# Altium schematic sheet Controller_Sheet.SchDoc
size 420 x 297 mm; SheetNumber: 4; SheetTotal: 12
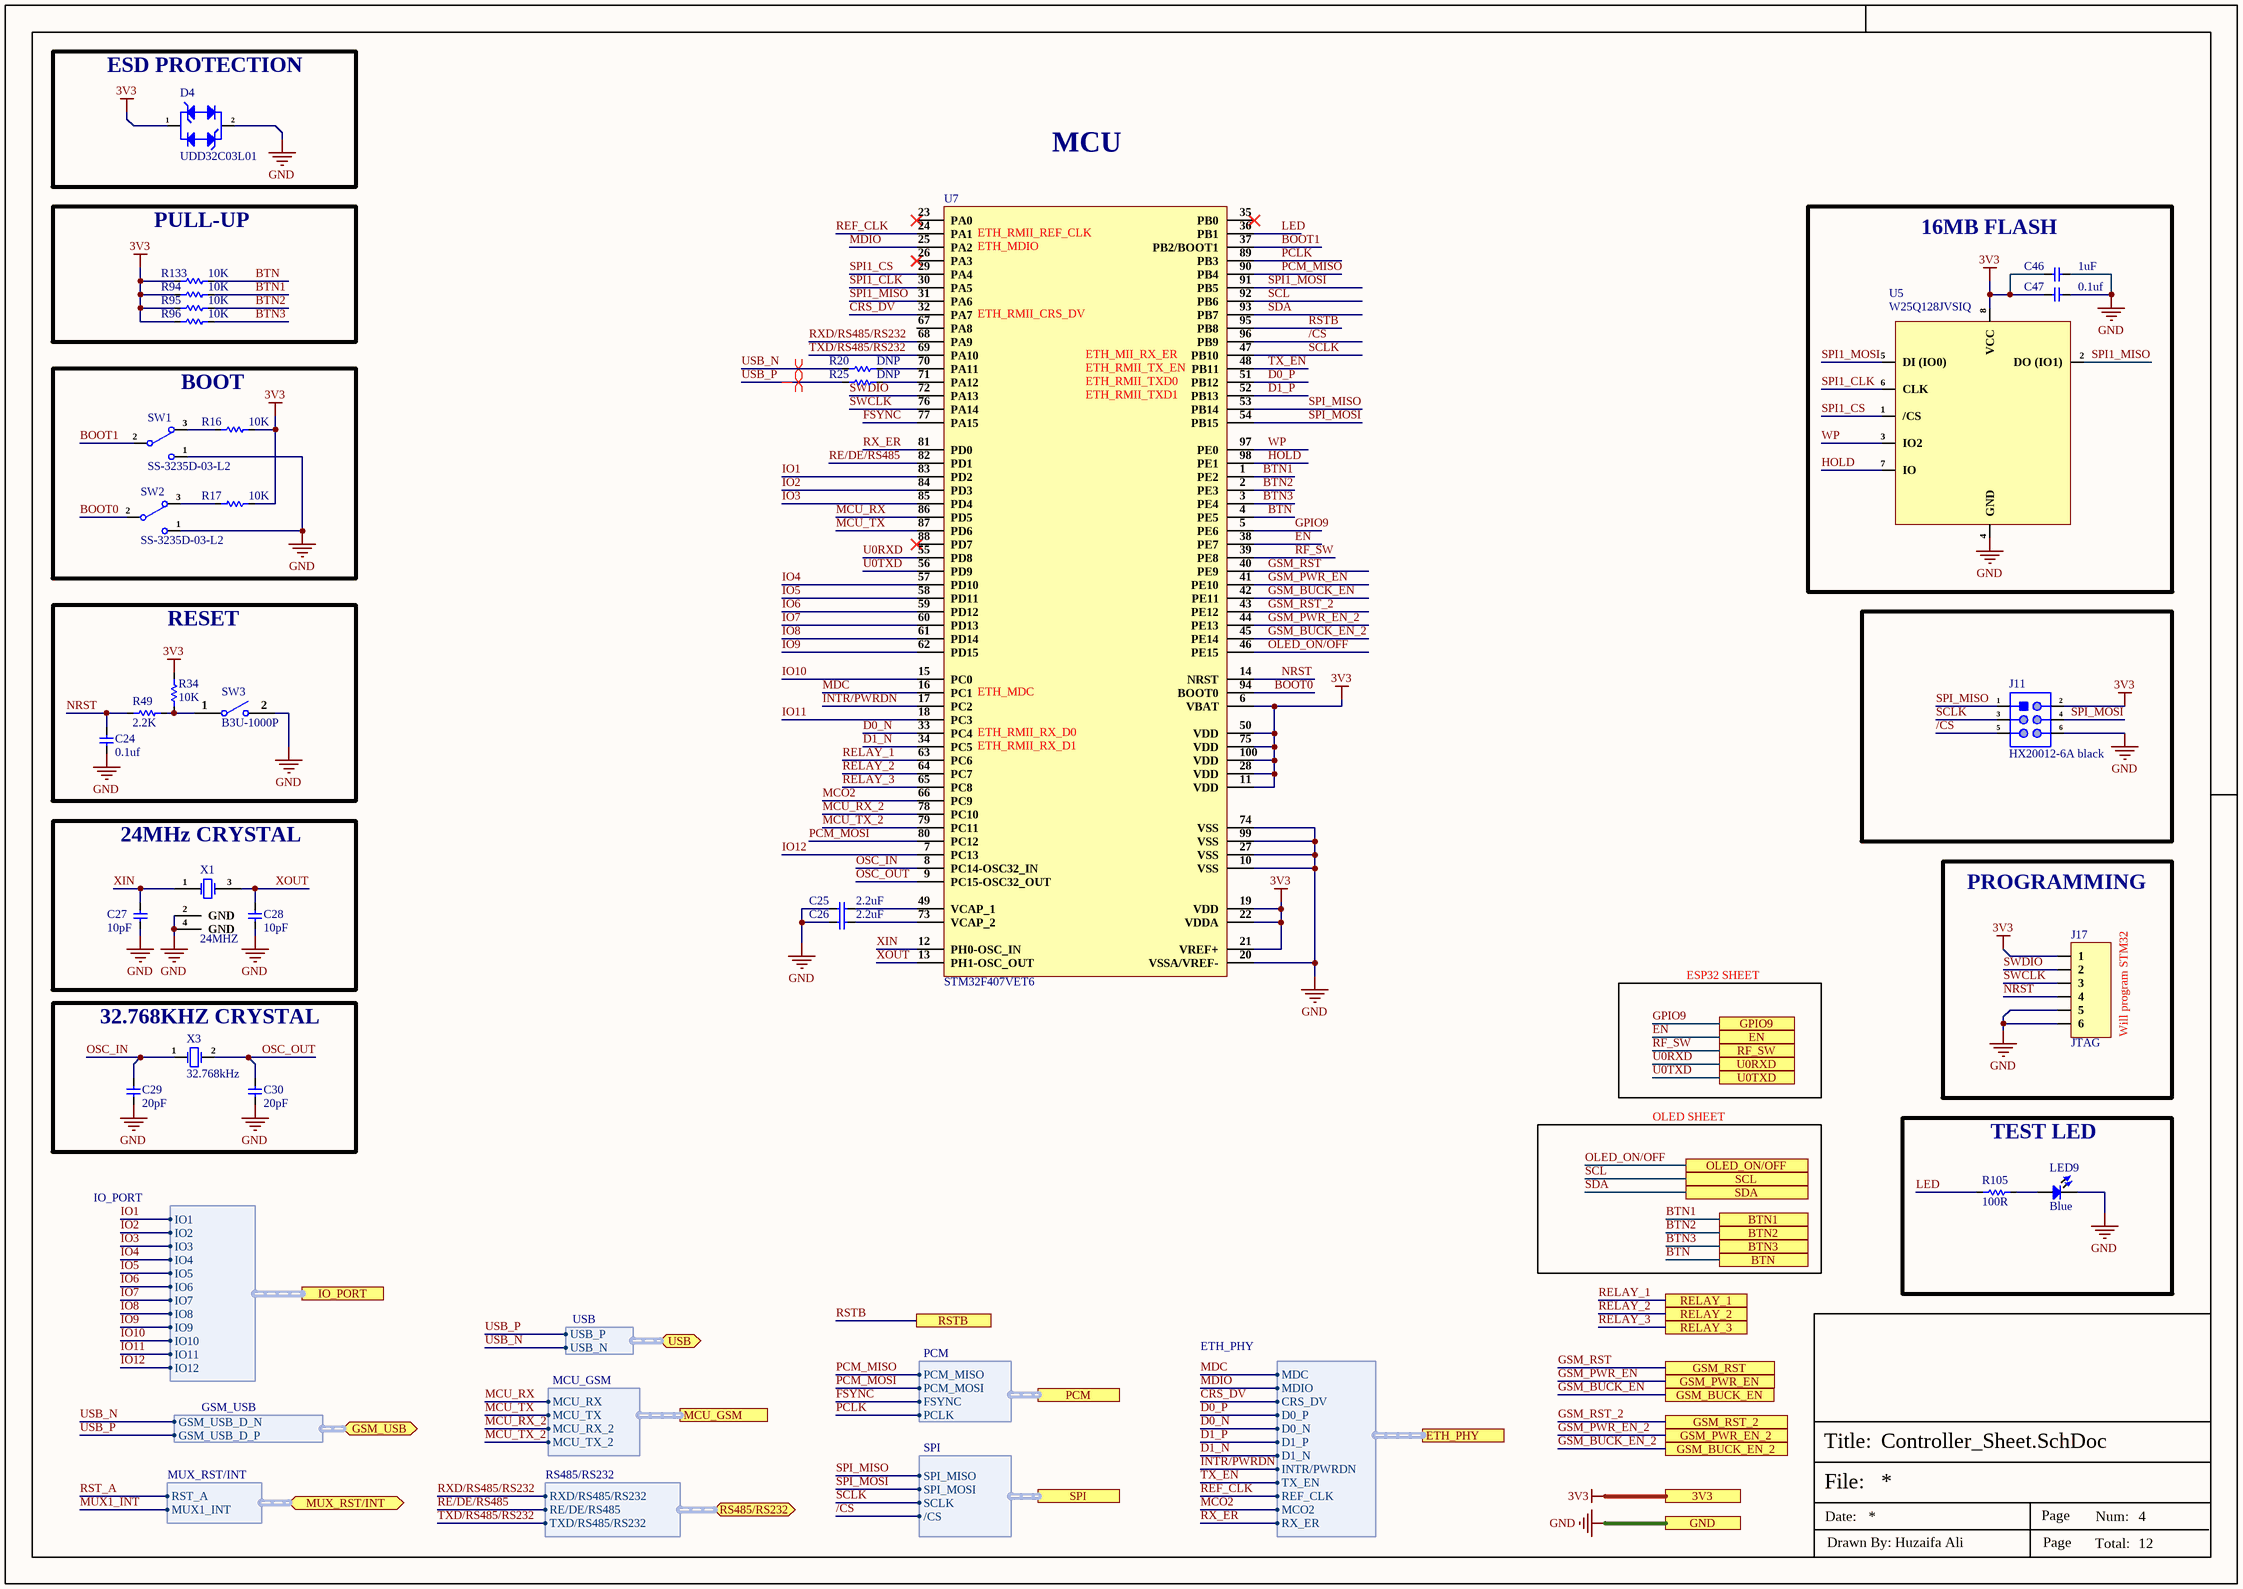
[diagram p0: Controller_Sheet.SchDoc]

## Parts
C24  0.1uf  [Cap-0402]
C25  2.2uF  [Cap-0603]
C26  2.2uF  [Cap-0603]
C27  10pF  [Cap-0603]
C28  10pF  [Cap-0603]
C29  20pF  [Cap-0603]
C30  20pF  [Cap-0603]
C46  1uF  [CAP-0201]
C47  0.1uf  [Cap-0402]
D4  UDD32C03L01  [SOD-323]
J11  HX20012-6A black  [HX20012-6A black]
J17  JTAG  [POGO 6 Pin]
LED9  Blue  [LED-0603]
R16  10K  [Res-0201]
R17  10K  [Res-0201]
R20  DNP  [Res-0402]
R25  DNP  [Res-0402]
R34  10K  [Res-0201]
R49  2.2K  [Res-0603]
R94  10K  [Res-0201]
R95  10K  [Res-0201]
R96  10K  [Res-0201]
R105  100R  [Res-0402]
R133  10K  [Res-0201]
SW1  SS-3235D-03-L2  [SS-3235D-03-L2_]
SW2  SS-3235D-03-L2  [SS-3235D-03-L2_]
SW3  B3U-1000P  [B3U-1000P]
U5  W25Q128JVSIQ  [SOIC-8 (208 mil)]
U7  STM32F407VET6  [LQFP-100]
X1  24MHZ  [X322524MOB4SI-]
X3  32.768kHz  [SMD2012-2P]

## Blocks framed on the sheet
ESD PROTECTION: D4
PULL-UP: R94-R96 R133
16MB FLASH: C46 C47 U5
BOOT: R16 R17 SW1 SW2
RESET: C24 R34 R49 SW3
24MHz CRYSTAL: C27 C28 X1
PROGRAMMING: J17
32.768KHZ CRYSTAL: C29 C30 X3
TEST LED: LED9 R105

## Ports
3V3, BTN, BTN1, BTN2, BTN3, EN, ETH_PHY (harness ETH_PHY), GND, GPIO9, GSM_BUCK_EN, GSM_BUCK_EN_2, GSM_PWR_EN, GSM_PWR_EN_2, GSM_RST, GSM_RST_2, GSM_USB (bidir, harness GSM_USB), IO_PORT (harness IO_PORT), MCU_GSM (harness MCU_GSM), MUX_RST/INT (bidir, harness MUX_RST/INT), OLED_ON/OFF, PCM (harness PCM), RELAY_1, RELAY_2, RELAY_3, RF_SW, RS485/RS232 (bidir, harness RS485/RS232), RSTB, SCL, SDA, SPI (harness SPI), U0RXD, U0TXD, USB (bidir, harness USB)

## Harnesses
RS485/RS232: RXD/RS485/RS232, RE/DE/RS485, TXD/RS485/RS232
MUX_RST/INT: RST_A, MUX1_INT
GSM_USB: GSM_USB_D_N, GSM_USB_D_P
MCU_GSM: MCU_RX, MCU_TX, MCU_RX_2, MCU_TX_2
SPI: SPI_MISO, SPI_MOSI, SCLK, /CS
IO_PORT: IO1, IO2, IO3, IO4, IO5, IO6, IO7, IO9, IO10, IO11, IO12, IO8
PCM: PCM_MISO, PCM_MOSI, FSYNC, PCLK
USB: USB_P, USB_N
ETH_PHY: MDC, MDIO, CRS_DV, D0_P, D0_N, D1_P, D1_N, INTR/PWRDN, TX_EN, REF_CLK, MCO2, RX_ER

## Nets
3V3: C46.1 C47.1 D4.1 J11.2 J17.1 R16.2 R17.2 R34.2 R94.1 R95.1 R96.1 R133.2 U5.8(VCC) U7.6(VBAT) U7.11(VDD) U7.19(VDD) U7.21(VREF+) U7.22(VDDA) U7.28(VDD) U7.50(VDD) U7.75(VDD) U7.100(VDD) ; port 3V3
GND: C24.1 C25.1 C26.1 C27.1 C28.1 C29.1 C30.1 C46.2 C47.2 D4.2 J11.6 J17.5 J17.6 LED9.2 SW1.1 SW2.1 SW3.2 U5.4(GND) U7.10(VSS) U7.20(VSSA/VREF-) U7.27(VSS) U7.74(VSS) U7.99(VSS) X1.2(GND) X1.4(GND) ; port GND
/CS: J11.5 U7.96(PB9) ; port SPI./CS
BOOT0: SW2.2 U7.94(BOOT0)
BOOT1: SW1.2 U7.37(PB2/BOOT1)
BTN: R133.1 U7.4(PE5) ; port BTN
BTN1: R94.2 U7.1(PE2) ; port BTN1
BTN2: R95.2 U7.2(PE3) ; port BTN2
BTN3: R96.2 U7.3(PE4) ; port BTN3
CRS_DV: U7.32(PA7) ; port ETH_PHY.CRS_DV
D0_N: U7.33(PC4) ; port ETH_PHY.D0_N
D0_P: U7.51(PB12) ; port ETH_PHY.D0_P
D1_N: U7.34(PC5) ; port ETH_PHY.D1_N
D1_P: U7.52(PB13) ; port ETH_PHY.D1_P
EN: U7.38(PE7) ; port EN
FSYNC: U7.77(PA15) ; port PCM.FSYNC
GPIO9: U7.5(PE6) ; port GPIO9
GSM_BUCK_EN: U7.42(PE11) ; port GSM_BUCK_EN
GSM_BUCK_EN_2: U7.45(PE14) ; port GSM_BUCK_EN_2
GSM_PWR_EN: U7.41(PE10) ; port GSM_PWR_EN
GSM_PWR_EN_2: U7.44(PE13) ; port GSM_PWR_EN_2
GSM_RST: U7.40(PE9) ; port GSM_RST
GSM_RST_2: U7.43(PE12) ; port GSM_RST_2
HOLD: U5.7(IO) U7.98(PE1)
INTR/PWRDN: U7.17(PC2) ; port ETH_PHY.INTR/PWRDN
IO1: U7.83(PD2) ; port IO_PORT.IO1
IO2: U7.84(PD3) ; port IO_PORT.IO2
IO3: U7.85(PD4) ; port IO_PORT.IO3
IO4: U7.57(PD10) ; port IO_PORT.IO4
IO5: U7.58(PD11) ; port IO_PORT.IO5
IO6: U7.59(PD12) ; port IO_PORT.IO6
IO7: U7.60(PD13) ; port IO_PORT.IO7
IO8: U7.61(PD14) ; port IO_PORT.IO8
IO9: U7.62(PD15) ; port IO_PORT.IO9
IO10: U7.15(PC0) ; port IO_PORT.IO10
IO11: U7.18(PC3) ; port IO_PORT.IO11
IO12: U7.7(PC13) ; port IO_PORT.IO12
LED: R105.1 U7.36(PB1)
MCO2: U7.66(PC9) ; port ETH_PHY.MCO2
MCU_RX: U7.86(PD5) ; port MCU_GSM.MCU_RX
MCU_RX_2: U7.78(PC10) ; port MCU_GSM.MCU_RX_2
MCU_TX: U7.87(PD6) ; port MCU_GSM.MCU_TX
MCU_TX_2: U7.79(PC11) ; port MCU_GSM.MCU_TX_2
MDC: U7.16(PC1) ; port ETH_PHY.MDC
MDIO: U7.25(PA2) ; port ETH_PHY.MDIO
MUX1_INT: port MUX_RST/INT.MUX1_INT
NRST: C24.2 J17.4 R49.1 U7.14(NRST)
OLED_ON/OFF: U7.46(PE15) ; port OLED_ON/OFF
OSC_IN: C29.2 U7.8(PC14-OSC32_IN) X3.1(OSC1)
OSC_OUT: C30.2 U7.9(PC15-OSC32_OUT) X3.2(OSC2)
PCLK: U7.89(PB3) ; port PCM.PCLK
PCM_MISO: U7.90(PB4) ; port PCM.PCM_MISO
PCM_MOSI: U7.80(PC12) ; port PCM.PCM_MOSI
RE/DE/RS485: U7.82(PD1) ; port RS485/RS232.RE/DE/RS485
REF_CLK: U7.24(PA1) ; port ETH_PHY.REF_CLK
RELAY_1: U7.63(PC6) ; port RELAY_1
RELAY_2: U7.64(PC7) ; port RELAY_2
RELAY_3: U7.65(PC8) ; port RELAY_3
RF_SW: U7.39(PE8) ; port RF_SW
RST_A: port MUX_RST/INT.RST_A
RSTB: U7.95(PB8) ; port RSTB
RX_ER: U7.81(PD0) ; port ETH_PHY.RX_ER
RXD/RS485/RS232: U7.68(PA9) ; port RS485/RS232.RXD/RS485/RS232
SCL: U7.92(PB6) ; port SCL
SCLK: J11.3 U7.47(PB10) ; port SPI.SCLK
SDA: U7.93(PB7) ; port SDA
SPI1_CLK: U5.6(CLK) U7.30(PA5)
SPI1_CS: U5.1(/CS) U7.29(PA4)
SPI1_MISO: U5.2(DO_(IO1)) U7.31(PA6)
SPI1_MOSI: U5.5(DI_(IO0)) U7.91(PB5)
SPI_MISO: J11.1 U7.53(PB14) ; port SPI.SPI_MISO
SPI_MOSI: J11.4 U7.54(PB15) ; port SPI.SPI_MOSI
SWCLK: J17.3 U7.76(PA14)
SWDIO: J17.2 U7.72(PA13)
TX_EN: U7.48(PB11) ; port ETH_PHY.TX_EN
TXD/RS485/RS232: U7.69(PA10) ; port RS485/RS232.TXD/RS485/RS232
U0RXD: U7.55(PD8) ; port U0RXD
U0TXD: U7.56(PD9) ; port U0TXD
USB_N: R20.1 ; port GSM_USB.GSM_USB_D_N, port USB.USB_N
USB_P: R25.1 ; port GSM_USB.GSM_USB_D_P, port USB.USB_P
WP: U5.3(IO2) U7.97(PE0)
XIN: C27.2 U7.12(PH0-OSC_IN) X1.1(CRYSTAL)
XOUT: C28.2 U7.13(PH1-OSC_OUT) X1.3(CRYSTAL)
NetC25_2: C25.2 U7.49(VCAP_1)
NetC26_2: C26.2 U7.73(VCAP_2)
NetLED9_1: LED9.1 R105.2
NetR16_1: R16.1 SW1.3
NetR17_1: R17.1 SW2.3
NetR20_2: R20.2 U7.70(PA11)
NetR25_2: R25.2 U7.71(PA12)
NetR34_1: R34.1 R49.2 SW3.1

Not connected (* = marked no-connect by the designer): U7 23(PA0)* 26(PA3)* 35(PB0)* 67(PA8) 88(PD7)*

## Layout directives
differential pair; net class USB; differential pair class USB_Lines; rule Impedance Constraint [Min = 88.00    Max = 90.00    ]; rule Matched Net Lengths [Tolerance = 20mil]: USB_N, USB_P

## Notes on the sheet
- MCU
- (near U7) ETH_RMII_REF_CLK
- (near U7) ETH_MDIO
- (near U7) ETH_RMII_CRS_DV
- (near U7) ETH_RMII_TX_EN
- (near U7) ETH_RMII_TXD0
- (near U7) ETH_RMII_TXD1
- (near U7) ETH_MII_RX_ER
- (near U7) ETH_MDC
- (near U7) ETH_RMII_RX_D0
- (near U7) ETH_RMII_RX_D1
- ESP32 SHEET
- (near J17) Will program STM32
- OLED SHEET
- File:
- Title:
- Date:
- Page
- Num:
- Total:
- Drawn By: Huzaifa Ali

## Library data of the parts
C24 C47 = GRM155R62A104KE14D: CAP CER 0.1UF 100V X5R 0402; Manufacturer: Murata; Capacitance: 100nF; Tolerance: 10%; Item Type: Capacitor; Supplier 1: Arrow Electronics; Manufacturer Part Number: GRM155R62A104KE14D; RoHS: Yes; Category: Ceramic Capacitors; Stock 1: 870000; Pricing 1: 10000=0.00500, 20000=0.00410, 30000=0.00390, 50000=0.00370, 100000=0.00300 (USD); Mount: Surface Mount; Case/Package: 0402; Case Code (Metric): 1005; Case Code (Imperial): 0402; Weight: 0.000212oz; Min Operating Temperature: -55°C; Max Operating Temperature: 85°C; Packaging: Tape and Reel; Voltage Rating: 100V; Dielectric: X5R; Termination: SMD/SMT; Voltage Rating (DC): 100V; Package Quantity: 10000; Series: GRM; Length: 0.039inch; Width: 0.02inch; Height: 0.5mm; Thickness: 0.022inch; Reach SVHC Compliant: Yes; Lead Free: Lead Free; RoHS Compliant: Yes; ComponentLink1URL: http://www.farnell.com/datasheets/2079151.pdf?src-supplier=Farnell; ComponentLink1Description: http://www.farnell.com/datasheets/2079151.pdf?src-supplier=Farnell; ComponentLink2URL: http://www.mouser.com/ds/2/281/c02e-2905.pdf?src-supplier=Mouser; ComponentLink2Description: http://www.mouser.com/ds/2/281/c02e-2905.pdf?src-supplier=Mouser; ComponentLink3URL: http://www.farnell.com/datasheets/2079151.pdf?src-supplier=Element14; ComponentLink3Description: http://www.farnell.com/datasheets/2079151.pdf?src-supplier=Element14; ComponentLink4URL: http://search.murata.co.jp/Ceramy/image/img/A01X/G101/ENG/GRM155R62A104KE14-01.pdf?src-supplier=Digi-Key; ComponentLink4Description: http://search.murata.co.jp/Ceramy/image/img/A01X/G101/ENG/GRM155R62A104KE14-01.pdf?src-supplier=Digi-Key; ComponentLink5URL: http://www.farnell.com/datasheets/2079151.pdf?src-supplier=Newark; ComponentLink5Description: http://www.farnell.com/datasheets/2079151.pdf?src-supplier=Newark; Supplier Part Number 1: GRM155R62A104KE14D; LCSC Part Number: C162178
C25 C26 = CL10A225KA8NNNC: CAP CER 2.2UF 25V X5R 0603; Manufacturer: Samsung; Tolerance: 10%; Supplier 1: Digi-Key; Manufacturer Part Number: CL10A225KA8NNNC; RoHS: Yes; Category: Ceramic Capacitors; Stock 1: 168888; Pricing 1: 1=0.22000, 10=0.15000, 50=0.09000, 100=0.07610, 500=0.05206, 1000=0.04605 (USD); Mount: Surface Mount; Case/Package: 0603; Case Code (Metric): 1608; Case Code (Imperial): 0603; Min Operating Temperature: -55°C; Max Operating Temperature: 85°C; Capacitance: 2.2uF; Packaging: Tape and Reel; Package Quantity: 1; Voltage Rating: 25V; Dielectric: X5R; Voltage Rating (DC): 25V; Series: CL; Construction: Flat; Length: 1.6mm; Width: 0.031inch; Height: 0.8mm; Thickness: 0.035inch; Depth: 0.8mm; Radiation Hardening: No; Lead Free: Lead Free; RoHS Compliant: Yes; ComponentLink1URL: https://datasheet.ciiva.com/25797/cl10a225ka8nnnc-25797781.pdf?src-supplier=Digi-Key; ComponentLink1Description: https://datasheet.ciiva.com/25797/cl10a225ka8nnnc-25797781.pdf?src-supplier=Digi-Key; Supplier Part Number 1: 1276-1879-1-ND; LCSC Part Number: C57895
C27 C28 = CC0603JRNPO9BN100: CAP CER 10PF 50V C0G/NPO 0603; Manufacturer: Yageo; Tolerance: 5%; Dielectric: C0G; Temperature Coefficient: 30ppm/°C; Insulation Resistance: 100GR; ComponentLink1URL: https://datasheet.ciiva.com/25787/cl10a475ka8nqnc-25787017.pdf?src-supplier=Digi-Key; ComponentLink1Description: https://datasheet.ciiva.com/25787/cl10a475ka8nqnc-25787017.pdf?src-supplier=Digi-Key; ComponentLink2URL: https://datasheet.ciiva.com/144/mlccorderingcode-144651.pdf?src-supplier=Digi-Key; ComponentLink2Description: https://datasheet.ciiva.com/144/mlccorderingcode-144651.pdf?src-supplier=Digi-Key; ComponentLink3URL: https://datasheet.ciiva.com/11786/0900766b8079c870-11786407.pdf?src-supplier=RSComponents; ComponentLink3Description: https://datasheet.ciiva.com/11786/0900766b8079c870-11786407.pdf?src-supplier=RSComponents; ComponentLink4URL: https://datasheet.ciiva.com/5789/1734582-5789616.pdf?src-supplier=Farnell; ComponentLink4Description: https://datasheet.ciiva.com/5789/1734582-5789616.pdf?src-supplier=Farnell; ComponentLink5URL: https://datasheet.ciiva.com/26862/getdatasheetpartid-403524-26862758.pdf?src-supplier=Verical; ComponentLink5Description: https://datasheet.ciiva.com/26862/getdatasheetpartid-403524-26862758.pdf?src-supplier=Verical; ComponentLink6URL: https://datasheet.ciiva.com/7978/1132289-7978126.pdf?src-supplier=Element14; ComponentLink6Description: https://datasheet.ciiva.com/7978/1132289-7978126.pdf?src-supplier=Element14; ComponentLink7URL: https://datasheet.ciiva.com/46430/1835847-46430150.pdf?src-supplier=Element14; ComponentLink7Description: https://datasheet.ciiva.com/46430/1835847-46430150.pdf?src-supplier=Element14; ComponentLink8URL: https://datasheet.ciiva.com/144/mlccorderingcode-144650.pdf?src-supplier=Digi-Key; ComponentLink8Description: https://datasheet.ciiva.com/144/mlccorderingcode-144650.pdf?src-supplier=Digi-Key; ComponentLink9URL: https://datasheet.ciiva.com/144/mlccorderingcode-144649.pdf?src-supplier=Digi-Key; ComponentLink9Description: https://datasheet.ciiva.com/144/mlccorderingcode-144649.pdf?src-supplier=Digi-Key; ComponentLink10URL: https://datasheet.ciiva.com/5425/upy-gp-np0-16v-to-50v-8-5425564.pdf?src-supplier=Mouser; ComponentLink10Description: https://datasheet.ciiva.com/5425/upy-gp-np0-16v-to-50v-8-5425564.pdf?src-supplier=Mouser; ComponentLink11URL: https://datasheet.ciiva.com/8033/1734582-8033710.pdf?src-supplier=Element14; ComponentLink11Description: https://datasheet.ciiva.com/8033/1734582-8033710.pdf?src-supplier=Element14; ComponentLink12URL: https://datasheet.ciiva.com/8033/1734582-8033706.pdf?src-supplier=Element14; ComponentLink12Description: https://datasheet.ciiva.com/8033/1734582-8033706.pdf?src-supplier=Element14; Supplier 1: Digi-Key; Manufacturer Part Number: CC0603JRNPO9BN100; RoHS: Yes; Category: Ceramic Capacitors; Stock 1: 1700978; Pricing 1: 1=0.10000, 10=0.03900, 50=0.02120, 100=0.01740, 500=0.01240, 1000=0.00974 (USD); Mount: Surface Mount; Case/Package: 0603; Number of Pins: 2; Case Code (Metric): 1608; Case Code (Imperial): 0603; Min Operating Temperature: -55°C; Max Operating Temperature: 125°C; Capacitance: 10pF; Voltage: 50V; Voltage Rating: 50V; Voltage Rating (DC): 50V; Packaging: Tape and Reel; Package Quantity: 1; Termination: SMD/SMT; Resistor Type: Ceramic; Series: CC; Length: 1.6mm; Width: 0.031inch; Height: 0.8mm; Thickness: 0.035inch; Depth: 0.8mm; Radiation Hardening: No; RoHS Compliant: Yes; REACH SVHC: No SVHC; Lead Free: Lead Free; Supplier Part Number 1: 311-1058-1-ND; LCSC Part Number: C106245
C29 C30 = CC0603JRNPO9BN200: CAP CER 20PF 50V C0G/NPO 0603; Manufacturer: Yageo; Tolerance: 5%; Dielectric: C0G; Item Type: Capacitor; Supplier 1: Digi-Key; Manufacturer Part Number: CC0603JRNPO9BN200; Stock 1: 259568; Pricing 1: 1=0.1, 10=0.048, 100=0.0214, 500=0.01526, 1000=0.01198 (USD); Mount: Surface Mount; Case/Package: 0603; Number of Pins: 2; Weight: 7.1E-05oz; Case Code (Imperial): 0603; Case Code (Metric): 1608; Min Operating Temperature: -55°C; Max Operating Temperature: 125°C; Capacitance: 20pF; Package Quantity: 4000; Voltage Rating (DC): 50V; Packaging: Tape and Reel; Voltage Rating: 50V; Termination: SMD/SMT; Composition: Ceramic; Length: 1.6mm; Width: 0.8mm; Thickness: 0.035inch; Depth: 0.8mm; REACH SVHC: Unknown; Lead Free: Lead Free; ComponentLink1URL: http://www.farnell.com/datasheets/1132289.pdf?src-supplier=Element14; ComponentLink1Description: http://www.farnell.com/datasheets/1132289.pdf?src-supplier=Element14; ComponentLink2URL: http://www.yageo.com/documents/recent/UPY-GP_NP0_16V-to-50V_16.pdf?src-supplier=Digi-Key; ComponentLink2Description: http://www.yageo.com/documents/recent/UPY-GP_NP0_16V-to-50V_16.pdf?src-supplier=Digi-Key; Supplier Part Number 1: 311-1424-6-ND; LCSC Part Number: C105621
C46 = CC0201MRX5R7BB105: CAP CER 1UF 16V X5R 0201; Manufacturer: Yageo; Item Type: Capacitor; Supplier: Digi-Key; Supplier Part Number: 13-CC0201MRX5R7BB105TR-ND; Manufacturer Part Number: CC0201MRX5R7BB105; RoHS: Yes; Category: Ceramic Capacitors; LCSC Part Number: C5182464
D4 = UDD32C03L01: 15V 19A 3.3V 4V Bidirectional SOD-323 ESD Protection Devices ROHS; Manufacturer: Brightking; Item Type: ESD Diode; Manufacturer Part Number: UDD32C03L01; ComponentLink1Description: LCSC; ComponentLink1URL: https://lcsc.com/product-detail/span-style-background-color-ff0-ESD-span-Protection-Devices_Brightking-Elec-TAIWAN-UDD32C03L01_C78439.html; LCSC Part Number: C78439
J11 = HX20012-6A black: 2x3P 2 2mm 2mm male 3 -25℃~+85℃ 3A Straight Plugin,P=2mm Wire To Board / Wire To Wire Connector ROHS; Manufacturer: HX(Zhejiang Yueqing Hongxing Elec); Manufacturer Part Number: HX20012-6A black; Package: Plugin,P=2mm; LCSC Part Number: C469723; Item Type: Wire To Wire Connector; ComponentLink1Description: LCSC; ComponentLink1URL: https://jlcpcb.com/partdetail/475972-HX20012_6Ablack/C469723
J17 = POGO Connector 6 Pin: Pogo Pad 2.5mm 6 Pin
LED9 = NCD0603B3: blue 0603 Light Emitting Diodes (LED) ROHS; Manufacturer: Foshan NationStar Optoelectronics; Manufacturer Part Number: NCD0603B3; Package: 0603; LCSC Part Number: C158101; Item Type: LED; ComponentLink1Description: LCSC; ComponentLink1URL: https://www.lcsc.com/product-detail/Light-Emitting-Diodes-LED_Foshan-NationStar-Optoelectronics-NCD0603B3_C158101.html
R16 R17 R34 R94-R96 R133 = RC0201FR-0710KL: RES SMD 10K OHM 1% 1/20W 0201; Manufacturer: Yageo; Item Type: Resistor; Manufacturer Part Number: RC0201FR-0710KL; Package: 0201; ComponentLink7Description: LCSC; ComponentLink7URL: https://www.lcsc.com/product-detail/Chip-Resistor-Surface-Mount_YAGEO-RC0201FR-0710KL_C106225.html; LCSC Part Number: C106225
R20 R25 = RC0402FR-070RL: RES 0 OHM JUMPER 1/16W 0402; Manufacturer: Yageo; Resistance: 0R; Tolerance: 1%; Power Rating: 62.5mW; Voltage Rating: 50V; Temperature Coefficient: 200ppm/°C; Max Power Dissipation: 63mW; Supplier 1: Mouser; Manufacturer Part Number: RC0402FR-070RL; RoHS: Yes; Category: Chip SMD Resistors; Stock 1: 8556842; Pricing 1: 1=0.10000, 10=0.01400, 50=0.01400, 100=0.00600, 1000=0.00300, 5000=0.00200, 10000=0.00100 (USD); Mount: Surface Mount; Case/Package: 0402; Contact Plating: Tin,Matte; Case Code (Imperial): 0402; Case Code (Metric): 1005; Size Code: 0402; Min Operating Temperature: -55°C; Max Operating Temperature: 155°C; Resistor Type: Thick Film; Packaging: Tape and Reel; Termination: SMD/SMT; Features: Moisture Resistant; Series: RC; Number of Terminations: 2; Length: 1mm; Width: 0.5mm; Height: 0.35mm; Radiation Hardening: No; Lead Free: Lead Free; RoHS Compliant: Yes; ComponentLink1URL: https://datasheet.ciiva.com/8896/pyu-rc0402-51-rohs-l-6-8896149.pdf?src-supplier=Avnet; ComponentLink1Description: https://datasheet.ciiva.com/8896/pyu-rc0402-51-rohs-l-6-8896149.pdf?src-supplier=Avnet; ComponentLink2URL: https://datasheet.ciiva.com/16790/pyu-rc0402-51-rohs-l-6-r-16790444.pdf?src-supplier=Future+Electronics; ComponentLink2Description: https://datasheet.ciiva.com/16790/pyu-rc0402-51-rohs-l-6-r-16790444.pdf?src-supplier=Future+Electronics; Supplier Part Number 1: 603-RC0402FR-070RL; LCSC Part Number: C106231
R49 = RT0603BRB072K2L: RES SMD 2.2K OHM 0.1% 1/10W 0603; Manufacturer: Yageo; Value: 2.2kR; Max Power Dissipation: 100mW; Temperature Coefficient: 10ppm/°C; Item Type: Resistor; Supplier: Digi-Key; Supplier Part Number: YAG2182CT-ND; Manufacturer Part Number: RT0603BRB072K2L; RoHS: Yes; Category: Chip SMD Resistors; Stock: 518; Pricing: 1=0.6, 10=0.446, 50=0.3148, 100=0.2597, 500=0.1836, 1000=0.14563 (USD); Case/Package: 0603; Case Code (Metric): 1608; Case Code (Imperial): 0603; Min Operating Temperature: -55°C; Max Operating Temperature: 155°C; Packaging: Cut Tape; Number of Terminations: 2; Tolerance: 0.1%; Series: RT; RoHS Compliant: Yes; ComponentLink1URL: http://www.yageo.com/documents/recent/PYu-RT_1-to-0.01_RoHS_L_7.pdf?src-supplier=Digi-Key; ComponentLink1Description: http://www.yageo.com/documents/recent/PYu-RT_1-to-0.01_RoHS_L_7.pdf?src-supplier=Digi-Key; ComponentLink2URL: http://www.yageo.com/documents/recent/PYu-RT_1-to-0.01_RoHS_L_9.pdf?src-supplier=Digi-Key; ComponentLink2Description: http://www.yageo.com/documents/recent/PYu-RT_1-to-0.01_RoHS_L_9.pdf?src-supplier=Digi-Key; LCSC Part Number: C860297
R105 = RC0402FR-07100RL: RES 100 OHM 1% 1/16W 0402; Manufacturer: Yageo; Power Rating: 62.5mW; Voltage Rating: 50V; Temperature Coefficient: 100ppm/°C; Max Power Dissipation: 63mW; Item Type: Resistor; Supplier 1: Mouser; Manufacturer Part Number: RC0402FR-07100RL; RoHS: Yes; Category: Chip SMD Resistors; Stock 1: 699545; Pricing 1: 1=0.10000, 10=0.01200, 50=0.01200, 100=0.00500, 1000=0.00300, 2500=0.00200, 10000=0.00100 (USD); Case/Package: 0402; Number of Pins: 2; Case Code (Imperial): 0402; Case Code (Metric): 1005; Size Code: 0402; Min Operating Temperature: -55°C; Max Operating Temperature: 155°C; Tolerance: 1%; Voltage Rating (DC): 50V; Resistance: 100R; Packaging: Tape and Reel; Termination: SMD/SMT; Resistor Type: Thick Film; Features: Moisture Resistant; Series: RC; Number of Terminations: 2; Resistance Tolerance: 1%; Construction: Rectangular; Technology: THICK FILM; Length: 1mm; Width: 0.5mm; Height: 0.32mm; Depth: 0.5mm; RoHS Compliant: Yes; REACH SVHC: No SVHC; Military Standard: Not; Lead Free: Lead Free; ComponentLink1URL: https://datasheet.ciiva.com/11808/0900766b80c66297-11808765.pdf?src-supplier=RSComponents; ComponentLink1Description: https://datasheet.ciiva.com/11808/0900766b80c66297-11808765.pdf?src-supplier=RSComponents; ComponentLink2URL: https://datasheet.ciiva.com/7849/1784430-7849810.pdf?src-supplier=Element14; ComponentLink2Description: https://datasheet.ciiva.com/7849/1784430-7849810.pdf?src-supplier=Element14; ComponentLink3URL: https://datasheet.ciiva.com/28367/1018594-28367226.pdf?src-supplier=Element14; ComponentLink3Description: https://datasheet.ciiva.com/28367/1018594-28367226.pdf?src-supplier=Element14; ComponentLink4URL: https://datasheet.ciiva.com/22747/1018594-22747511.pdf?src-supplier=Element14; ComponentLink4Description: https://datasheet.ciiva.com/22747/1018594-22747511.pdf?src-supplier=Element14; ComponentLink5URL: https://datasheet.ciiva.com/12667/pyu-rc0402-51-rohs-l-6-r-12667957.pdf?src-supplier=Mouser; ComponentLink5Description: https://datasheet.ciiva.com/12667/pyu-rc0402-51-rohs-l-6-r-12667957.pdf?src-supplier=Mouser; ComponentLink6URL: https://datasheet.ciiva.com/15189/getdatasheetpartid-329466-15189335.pdf?src-supplier=Verical; ComponentLink6Description: https://datasheet.ciiva.com/15189/getdatasheetpartid-329466-15189335.pdf?src-supplier=Verical; ComponentLink7URL: https://datasheet.ciiva.com/16740/pyu-rc0402-51-rohs-l-6-r-16740566.pdf?src-supplier=Future+Electronics; ComponentLink7Description: https://datasheet.ciiva.com/16740/pyu-rc0402-51-rohs-l-6-r-16740566.pdf?src-supplier=Future+Electronics; Supplier Part Number 1: 603-RC0402FR-07100RL; LCSC Part Number: C106232
SW1 SW2 = SS-3235D-03-L2: SPDT 50mA @ 12VDC 12V On-On SMD Toggle Switches RoHS; Manufacturer: XKB Connectivity; Actuator Orientation: Vertical; Switch Height: 3mm; Actuator Type: Standard; Electrical Life Cycles: 10000; Operating Force: 200±100gf; Package: SMD; Circuit: SPDT; Contact Rating @ Voltage: 50mA @ 12VDC; Rated Voltage(DC): 12V; Mounting Type: Surface Mount; Contact Material: Brass; Contact Finish: Silver; LCSC Part Number: C381097; Manufacturer Part Number: SS-3235D-03-L2; ComponentLink1Description: LCSC; ComponentLink1URL: https://www.lcsc.com/product-detail/Slide-Switches_XKB-Connectivity-SS-3235D-03-L2_C381097.html
SW3 = B3U-1000P: SWITCH TACTILE SPST-NO 0.05A 12V; Manufacturer: Omron; Mechanical Life: 200000Cycles; Operating Force: 1.5N; Throw Configuration: SPST; Current Rating: 50mA; Contact Resistance: 100mR; Illumination Type: Non-Illuminated,Illuminated; Switch Travel: 0.15mm; Switch Function: Off-Mom; Actuator Type: Standard; Actuator Length: 0.4mm; Ratings: Dust Proof,IP40; ComponentLink1URL: http://www.farnell.com/datasheets/60838.pdf?src-supplier=Farnell; ComponentLink1Description: http://www.farnell.com/datasheets/60838.pdf?src-supplier=Farnell; ComponentLink2URL: http://www.farnell.com/datasheets/60838.pdf?src-supplier=Element14; ComponentLink2Description: http://www.farnell.com/datasheets/60838.pdf?src-supplier=Element14; ComponentLink3URL: https://omronfs.omron.com/en_US/ecb/products/pdf/en-b3u.pdf?src-supplier=Digi-Key; ComponentLink3Description: https://omronfs.omron.com/en_US/ecb/products/pdf/en-b3u.pdf?src-supplier=Digi-Key; ComponentLink4URL: http://www.omron.com/ecb/products/pdf/en-b3u.pdf?src-supplier=Digi-Key; ComponentLink4Description: http://www.omron.com/ecb/products/pdf/en-b3u.pdf?src-supplier=Digi-Key; ComponentLink5URL: https://www.distrelec.biz/Web/Downloads/he/et/B3U_eng_datasheet.pdf?mime=application%2Fpdf&src-supplier=Distrelec; ComponentLink5Description: https://www.distrelec.biz/Web/Downloads/he/et/B3U_eng_datasheet.pdf?mime=application%2Fpdf&src-supplier=Distrelec; ComponentLink6URL: http://www.onlinecomponents.com/productFiles/mf-OM/en-b3u.pdf?src-supplier=Onlinecomponents.com; ComponentLink6Description: http://www.onlinecomponents.com/productFiles/mf-OM/en-b3u.pdf?src-supplier=Onlinecomponents.com; Supplier 1: Digi-Key; Manufacturer Part Number: B3U-1000P; Stock 1: 116454; Pricing 1: 1=1, 10=0.961, 25=0.9064, 50=0.7976, 100=0.7251, 250=0.68888, 500=0.67074, 1000=0.52571 (USD); Mount: Surface Mount; Weight: 0.000776oz; Contact Material: Silver; Min Operating Temperature: -25°C; Max Operating Temperature: 70°C; Packaging: Tape and Reel; Voltage Rating (DC): 12V; Package Quantity: 1; Max Current Rating: 50mA; Termination: SMD/SMT; Orientation: Straight; Max Voltage Rating (DC): 12V; Electrical Life: 200000Cycles; Insulation Resistance: 100MR; Contact Current Rating: 50mA; Length: 4mm; Height: 1.2mm; Depth: 2.5mm; Width: 3mm; REACH SVHC: Unknown; Lead Free: Lead Free; ComponentLink7URL: https://www.verical.com/server-webapp/html/getDatasheet?partID=552554&src-supplier=Verical; ComponentLink7Description: https://www.verical.com/server-webapp/html/getDatasheet?partID=552554&src-supplier=Verical; ComponentLink8URL: http://www.farnell.com/datasheets/1685550.pdf?src-supplier=Element14; ComponentLink8Description: http://www.farnell.com/datasheets/1685550.pdf?src-supplier=Element14; ComponentLink9URL: http://www.farnell.com/datasheets/2610940.pdf?src-supplier=Farnell; ComponentLink9Description: http://www.farnell.com/datasheets/2610940.pdf?src-supplier=Farnell; ComponentLink10URL: https://www.alliedelec.com/m/d/4c8a9ef82804fc3c241a13c1e298fd73.pdf?src-supplier=Allied+Electronics; ComponentLink10Description: https://www.alliedelec.com/m/d/4c8a9ef82804fc3c241a13c1e298fd73.pdf?src-supplier=Allied+Electronics; Supplier Part Number 1: SW1020DKR-ND; LCSC Part Number: C231329; Item Type: Switch
U5 = W25Q128JVSIQ: IC FLASH 128MBIT SPI/QUAD 8SOIC; Manufacturer: Winbond; Memory Format: Non-Volatile,FLASH; Frequency: 133MHz; Memory Size: 128Mb; Supplier: Arrow Electronics; Supplier Part Number: W25Q128JVSIQ; Manufacturer Part Number: W25Q128JVSIQ; RoHS: Yes; Category: Flash; Stock: 3659; Pricing: 1=1.6411, 10=1.4568, 25=1.4422, 50=1.3009, 100=1.2498, 250=1.2373, 500=1.1781, 1000=1.1392, 5000=1.0957 (USD); Mounting Technology: Surface Mount; Case/Package: SOIC; Min Operating Temperature: -40°C; Max Operating Temperature: 85°C; Packaging: Tray; Series: SpiFlash®; RoHS Compliant: Yes; ComponentLink1URL: http://www.winbond.com/resource-files/w25q128jv%20revf%2003272018%20plus.pdf?src-supplier=Digikey; ComponentLink1Description: http://www.winbond.com/resource-files/w25q128jv%20revf%2003272018%20plus.pdf?src-supplier=Digikey; LCSC Part Number: C97521; Item Type: IC
U7 = STM32F407VET6: IC MCU 32BIT 512KB FLASH 100LQFP; Manufacturer: STMicroelectronics; Frequency: 168MHz; Number of I/Os: 82; Interface: I2C,SPI,CAN,I2S,UART,USB,Ethernet,IrDA,USART,LIN,EBI/EMI; Oscillator Type: Internal; Peripherals: Brown-out Detect/Reset,POR,PWM,WDT,DMA,LCD,I2C; Core Architecture: ARM; RAM Size: 196KB; Number of ADC Channels: 16; Number of Ethernet Channels: 1; Number of Timers/Counters: 14; Number of UART Channels: 2; Max Supply Voltage: 3.6V; Min Supply Voltage: 1.8V; Data Bus Width: 32b; Number of SPI Channels: 3; Watchdog Timer: Yes; Supplier 1: Newark; Manufacturer Part Number: STM32F407VET6; RoHS: Yes; Category: Microcontrollers; Pricing 1: 1=16.05000, 10=14.76000, 25=14.15000, 50=13.31000, 100=12.47000 (USD); Case/Package: LQFP; Number of Pins: 100; Min Operating Temperature: -40°C; Max Operating Temperature: 85°C; Packaging: Tray; Memory Type: FLASH; Memory Size: 512KB; Package Quantity: 90; Number of Programmable I/O: 82; Max Frequency: 168MHz; Number of I2C Channels: 3; Series: STM32 F4; Number of PWM Channels: 2; Length: 14.2mm; Width: 14.2mm; Height: 1.45mm; Radiation Hardening: No; RoHS Compliant: Yes; REACH SVHC: No SVHC; Lead Free: Lead Free; ComponentLink1URL: https://datasheet.ciiva.com/16330/dm00037051-16330920.pdf?src-supplier=Future+Electronics; ComponentLink1Description: https://datasheet.ciiva.com/16330/dm00037051-16330920.pdf?src-supplier=Future+Electronics; ComponentLink2URL: https://datasheet.ciiva.com/8055/1717982-8055038.pdf?src-supplier=Element14; ComponentLink2Description: https://datasheet.ciiva.com/8055/1717982-8055038.pdf?src-supplier=Element14; ComponentLink3URL: https://datasheet.ciiva.com/4837/dm00037051-492832-4837637.pdf?src-supplier=Mouser; ComponentLink3Description: https://datasheet.ciiva.com/4837/dm00037051-492832-4837637.pdf?src-supplier=Mouser; Supplier Part Number 1: 73T7121; LCSC Part Number: C28730; Item Type: IC
X1 = X322524MOB4SI: 24MHz SMD Crystal Resonator 12pF ±10ppm ±30ppm -40℃~+85℃ SMD3225-4P Crystals ROHS; Manufacturer: Yangxing Tech; ComponentLink1Description: LCSC; ComponentLink1URL: https://www.lcsc.com/product-detail/Crystals_Yangxing-Tech-X322524MOB4SI_C70590.html; Manufacturer Part Number: X322524MOB4SI; Footprint: Custom; LCSC Part Number: C70590; Item Type: Crystal
X3 = FC-12M32.768KHZ7PF20PPM: CRYSTAL 32.7680KHZ 9PF SMD; Manufacturer: Seiko Epson; ComponentLink1Description: LCSC; ComponentLink1URL: https://www.lcsc.com/product-detail/Crystals_Seiko-Epson-FC-12M32-768KHZ7PF20PPM_C99009.html; Manufacturer Part Number: FC-12M32.768KHZ7PF20PPM; Package: SMD2012-2P; LCSC Part Number: C99009; Item Type: Crystal